# Altium schematic sheet 03_MCU_RP2350.SchDoc: Схема электрическая принципиальная
size 420 x 297 mm; ApprovedBy: Скрябин; CheckedBy: Скрябин; Author: Корсунов; CompanyName: РТУ МИРЭА; SheetNumber: 3; SheetTotal: 11; PageSetup: Record=PageOptions|CenterHorizontal=True|CenterVertical=True|PrintScale=0.94|XCorrection=1.00|YCorrection=1.00|PrintKind=1|BorderSize=5000000|LeftOffset=0|BottomOffset=0|Orientation=1|PaperLength=1000|PaperWidth=1000|Scale=100|PaperSource=7|PrintQuality=-4|MediaType=1|DitherType=10|PaperKind=A4|PrintScaleMode=1; DecimalNumber: RP23.000001.003 Э3; Name1: Модуль ввода-вывода; lit_A: О; Name2: RP2350 OPC UA
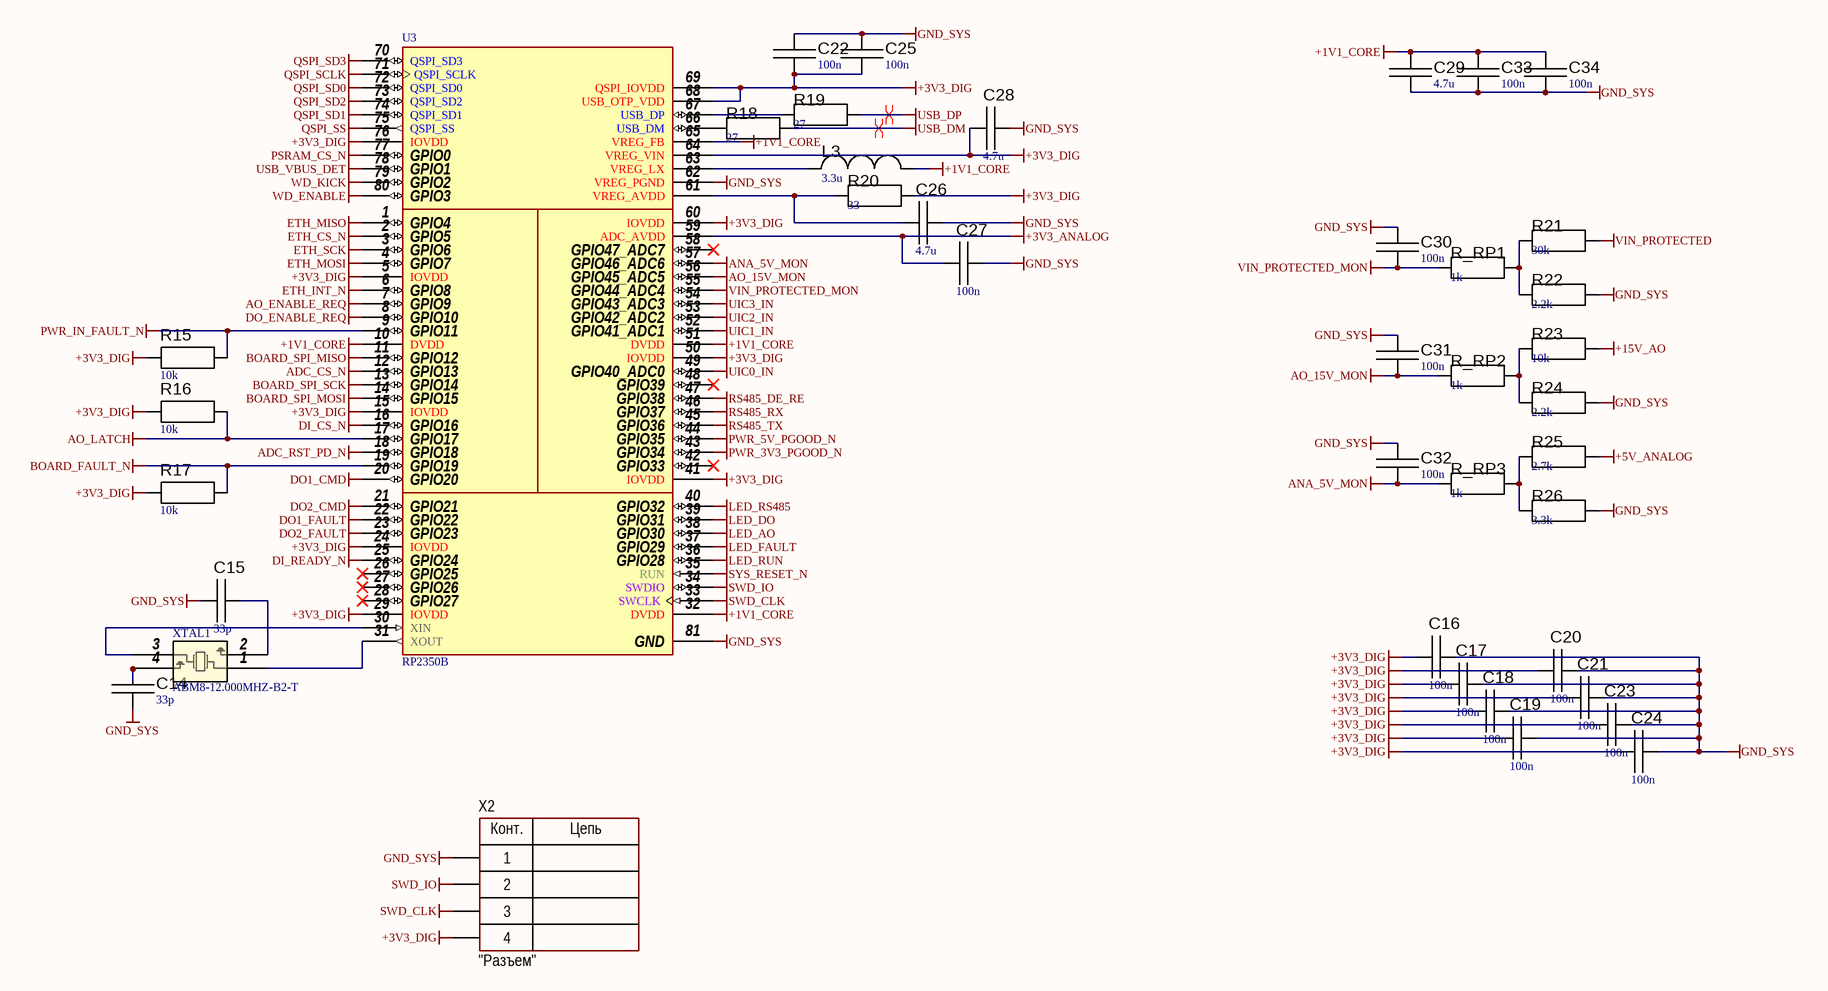
[diagram p0: 03_MCU_RP2350.SchDoc]

## Parts
C14  value 33p  [C_0603]  (hidden comment: Capacitor)
C15  value 33p  [C_0603]  (hidden comment: Capacitor)
C16  value 100n  [C_0603]  (hidden comment: Capacitor)
C17  value 100n  [C_0603]  (hidden comment: Capacitor)
C18  value 100n  [C_0603]  (hidden comment: Capacitor)
C19  value 100n  [C_0603]  (hidden comment: Capacitor)
C20  value 100n  [C_0603]  (hidden comment: Capacitor)
C21  value 100n  [C_0603]  (hidden comment: Capacitor)
C22  value 100n  [C_0603]  (hidden comment: Capacitor)
C23  value 100n  [C_0603]  (hidden comment: Capacitor)
C24  value 100n  [C_0603]  (hidden comment: Capacitor)
C25  value 100n  [C_0603]  (hidden comment: Capacitor)
C26  value 4.7u  [C_1206]  (hidden comment: Capacitor)
C27  value 100n  [C_0603]  (hidden comment: Capacitor)
C28  value 4.7u  [C_1206]  (hidden comment: Capacitor)
C29  value 4.7u  [C_1206]  (hidden comment: Capacitor)
C30  value 100n  [C_0603]  (hidden comment: Capacitor)
C31  value 100n  [C_0603]  (hidden comment: Capacitor)
C32  value 100n  [C_0603]  (hidden comment: Capacitor)
C33  value 100n  [C_0603]  (hidden comment: Capacitor)
C34  value 100n  [C_0603]  (hidden comment: Capacitor)
L3  value 3.3u  [L_AOTA_B201610]  (hidden comment: Inductor)
R15  value 10k  [R_0603]  (hidden comment: Resistor)
R16  value 10k  [R_0603]  (hidden comment: Resistor)
R17  value 10k  [R_0603]  (hidden comment: Resistor)
R18  value 27  [R_0603]  (hidden comment: Resistor)
R19  value 27  [R_0603]  (hidden comment: Resistor)
R20  value 33  [R_0603]  (hidden comment: Resistor)
R21  value 30k  [R_0603]  (hidden comment: Resistor)
R22  value 2.2k  [R_0603]  (hidden comment: Resistor)
R23  value 10k  [R_0603]  (hidden comment: Resistor)
R24  value 2.2k  [R_0603]  (hidden comment: Resistor)
R25  value 2.7k  [R_0603]  (hidden comment: Resistor)
R26  value 3.3k  [R_0603]  (hidden comment: Resistor)
R_RP1  value 1k  [R_0603]  (hidden comment: Resistor)
R_RP2  value 1k  [R_0603]  (hidden comment: Resistor)
R_RP3  value 1k  [R_0603]  (hidden comment: Resistor)
U3  RP2350B  [QFN40P1000X1000X85-81N]
X2  CommentText: "Разъем"  [CON: WF-04]
XTAL1  ABM8-12.000MHZ-B2-T  [ABM8_ABR]

## Nets
+1V1_CORE: C29.2 C33.2 C34.2 L3.2 U3.10(DVDD) U3.32(DVDD) U3.51(DVDD) U3.65(VREG_FB)
+3V3_ANALOG: C27.2 U3.59(ADC_AVDD)
+3V3_DIG: C16.2 C17.2 C18.2 C19.2 C20.2 C21.2 C22.2 C23.2 C24.2 C25.2 C28.2 R15.2 R16.2 R17.2 R20.2 U3.5(IOVDD) U3.15(IOVDD) U3.24(IOVDD) U3.29(IOVDD) U3.41(IOVDD) U3.50(IOVDD) U3.60(IOVDD) U3.64(VREG_VIN) U3.68(USB_OTP_VDD) U3.69(QSPI_IOVDD) U3.76(IOVDD) X2.4
+5V_ANALOG: R25.2
+15V_AO: R23.2
ADC_CS_N: U3.12(GPIO13)
ADC_RST_PD_N: U3.18(GPIO18)
ANA_5V_MON: C32.2 R_RP3.1 U3.57(GPIO46_ADC6)
AO_15V_MON: C31.2 R_RP2.1 U3.56(GPIO45_ADC5)
AO_ENABLE_REQ: U3.7(GPIO9)
AO_LATCH: R16.1 U3.17(GPIO17)
BOARD_FAULT_N: R17.1 U3.19(GPIO19)
BOARD_SPI_MISO: U3.11(GPIO12)
BOARD_SPI_MOSI: U3.14(GPIO15)
BOARD_SPI_SCK: U3.13(GPIO14)
DI_CS_N: U3.16(GPIO16)
DI_READY_N: U3.25(GPIO24)
DO1_CMD: U3.20(GPIO20)
DO1_FAULT: U3.22(GPIO22)
DO2_CMD: U3.21(GPIO21)
DO2_FAULT: U3.23(GPIO23)
DO_ENABLE_REQ: U3.8(GPIO10)
ETH_CS_N: U3.2(GPIO5)
ETH_INT_N: U3.6(GPIO8)
ETH_MISO: U3.1(GPIO4)
ETH_MOSI: U3.4(GPIO7)
ETH_SCK: U3.3(GPIO6)
GND_SYS: C14.1 C15.2 C16.1 C17.1 C18.1 C19.1 C20.1 C21.1 C22.1 C23.1 C24.1 C25.1 C26.1 C27.1 C28.1 C29.1 C30.1 C31.1 C32.1 C33.1 C34.1 R22.2 R24.2 R26.2 U3.62(VREG_PGND) U3.81(GND) X2.1
LED_AO: U3.38(GPIO30)
LED_DO: U3.39(GPIO31)
LED_FAULT: U3.37(GPIO29)
LED_RS485: U3.40(GPIO32)
LED_RUN: U3.36(GPIO28)
PSRAM_CS_N: U3.77(GPIO0)
PWR_3V3_PGOOD_N: U3.43(GPIO34)
PWR_5V_PGOOD_N: U3.44(GPIO35)
PWR_IN_FAULT_N: R15.1 U3.9(GPIO11)
QSPI_SCLK: U3.71(QSPI_SCLK)
QSPI_SD0: U3.72(QSPI_SD0)
QSPI_SD1: U3.74(QSPI_SD1)
QSPI_SD2: U3.73(QSPI_SD2)
QSPI_SD3: U3.70(QSPI_SD3)
QSPI_SS: U3.75(QSPI_SS)
RS485_DE_RE: U3.47(GPIO38)
RS485_RX: U3.46(GPIO37)
RS485_TX: U3.45(GPIO36)
SWD_CLK: U3.33(SWCLK) X2.3
SWD_IO: U3.34(SWDIO) X2.2
SYS_RESET_N: U3.35(RUN)
UIC0_IN: U3.49(GPIO40_ADC0)
UIC1_IN: U3.52(GPIO41_ADC1)
UIC2_IN: U3.53(GPIO42_ADC2)
UIC3_IN: U3.54(GPIO43_ADC3)
USB_DM: R18.2
USB_DP: R19.2
USB_VBUS_DET: U3.78(GPIO1)
VIN_PROTECTED: R21.2
VIN_PROTECTED_MON: C30.2 R_RP1.1 U3.55(GPIO44_ADC4)
WD_ENABLE: U3.80(GPIO3)
WD_KICK: U3.79(GPIO2)
NetC14_2: C14.2 XTAL1.4
NetC15_1: C15.1 XTAL1.2
NetC26_2: C26.2 R20.1 U3.61(VREG_AVDD)
NetL3_1: L3.1 U3.63(VREG_LX)
NetR18_1: R18.1 U3.66(USB_DM)
NetR19_1: R19.1 U3.67(USB_DP)
NetR21_1: R21.1 R22.1 R_RP1.2
NetR23_1: R23.1 R24.1 R_RP2.2
NetR25_1: R25.1 R26.1 R_RP3.2
NetU3_30: U3.30(XIN) XTAL1.3
NetU3_31: U3.31(XOUT) XTAL1.1

Not connected (* = marked no-connect by the designer): U3 26(GPIO25)* 27(GPIO26)* 28(GPIO27)* 42(GPIO33)* 48(GPIO39)* 58(GPIO47_ADC7)*

## Layout directives
differential pair: USB_DM, USB_DP

## Notes on the sheet
- Перв.примен.
- Справ.№
- Подп. и дата
- Инв.№ дубл.
- Взам.инв.№
- Подп.и дата
- Разраб.
- Изм.
- Лист
- № докум.
- Подп.
- Дата
- Лит.
- Масштаб
- Масса
- Т.контр.
- Пров.
- СХЕМА   ЭЛЕКТРИЧЕСКАЯ
- ПРИНЦИПИАЛЬНАЯ
- Листов
- Инв.№ подл.
- Утв.
- Н.контр.
- Нач.сект.
- Формат  A3
- (in symbol WF-4) Конт.; Цепь

## Library data of the parts
C14-C34 = Capacitor: SimulationGenericComponent: True
L3 = Inductor: SimulationGenericComponent: True
R15-R26 R_RP1-R_RP3 = Resistor: TC1: 0; SimulationGenericComponent: True; TC2: 0
U3 = RP2350B: RP2350B Microcontroller from Raspberry Pi; ComponentLink1Description: Datasheet; ComponentLink1URL: https://datasheets.raspberrypi.com/rp2350/rp2350-datasheet.pdf
X2 = WF-4: Manufacturer: Connfly; ValueManufacturerPartNumber: Connector, 4pin, 2.54mm, 250VAC, 3A; TypeConnector: Connector; VoltageMax: 250VAC; Pitch: 2.54mm; CurrentMax: 3A; Multichannel: 4pin; HelpURL: https://www.chipdip.ru/product/wf-4; PartNumber: WF-4
XTAL1 = ABM8-12.000MHZ-B2-T: No Description Available; Manufacturer_Name: Abracon; Copyright: Copyright (C) 2026 Ultra Librarian. All rights reserved.; Manufacturer_Part_Number: ABM8-12.000MHZ-B2-T; RefDes: RefDes; Type: Type